# Altium project rp2350_led_control.PrjPcb (part 2 of 2)
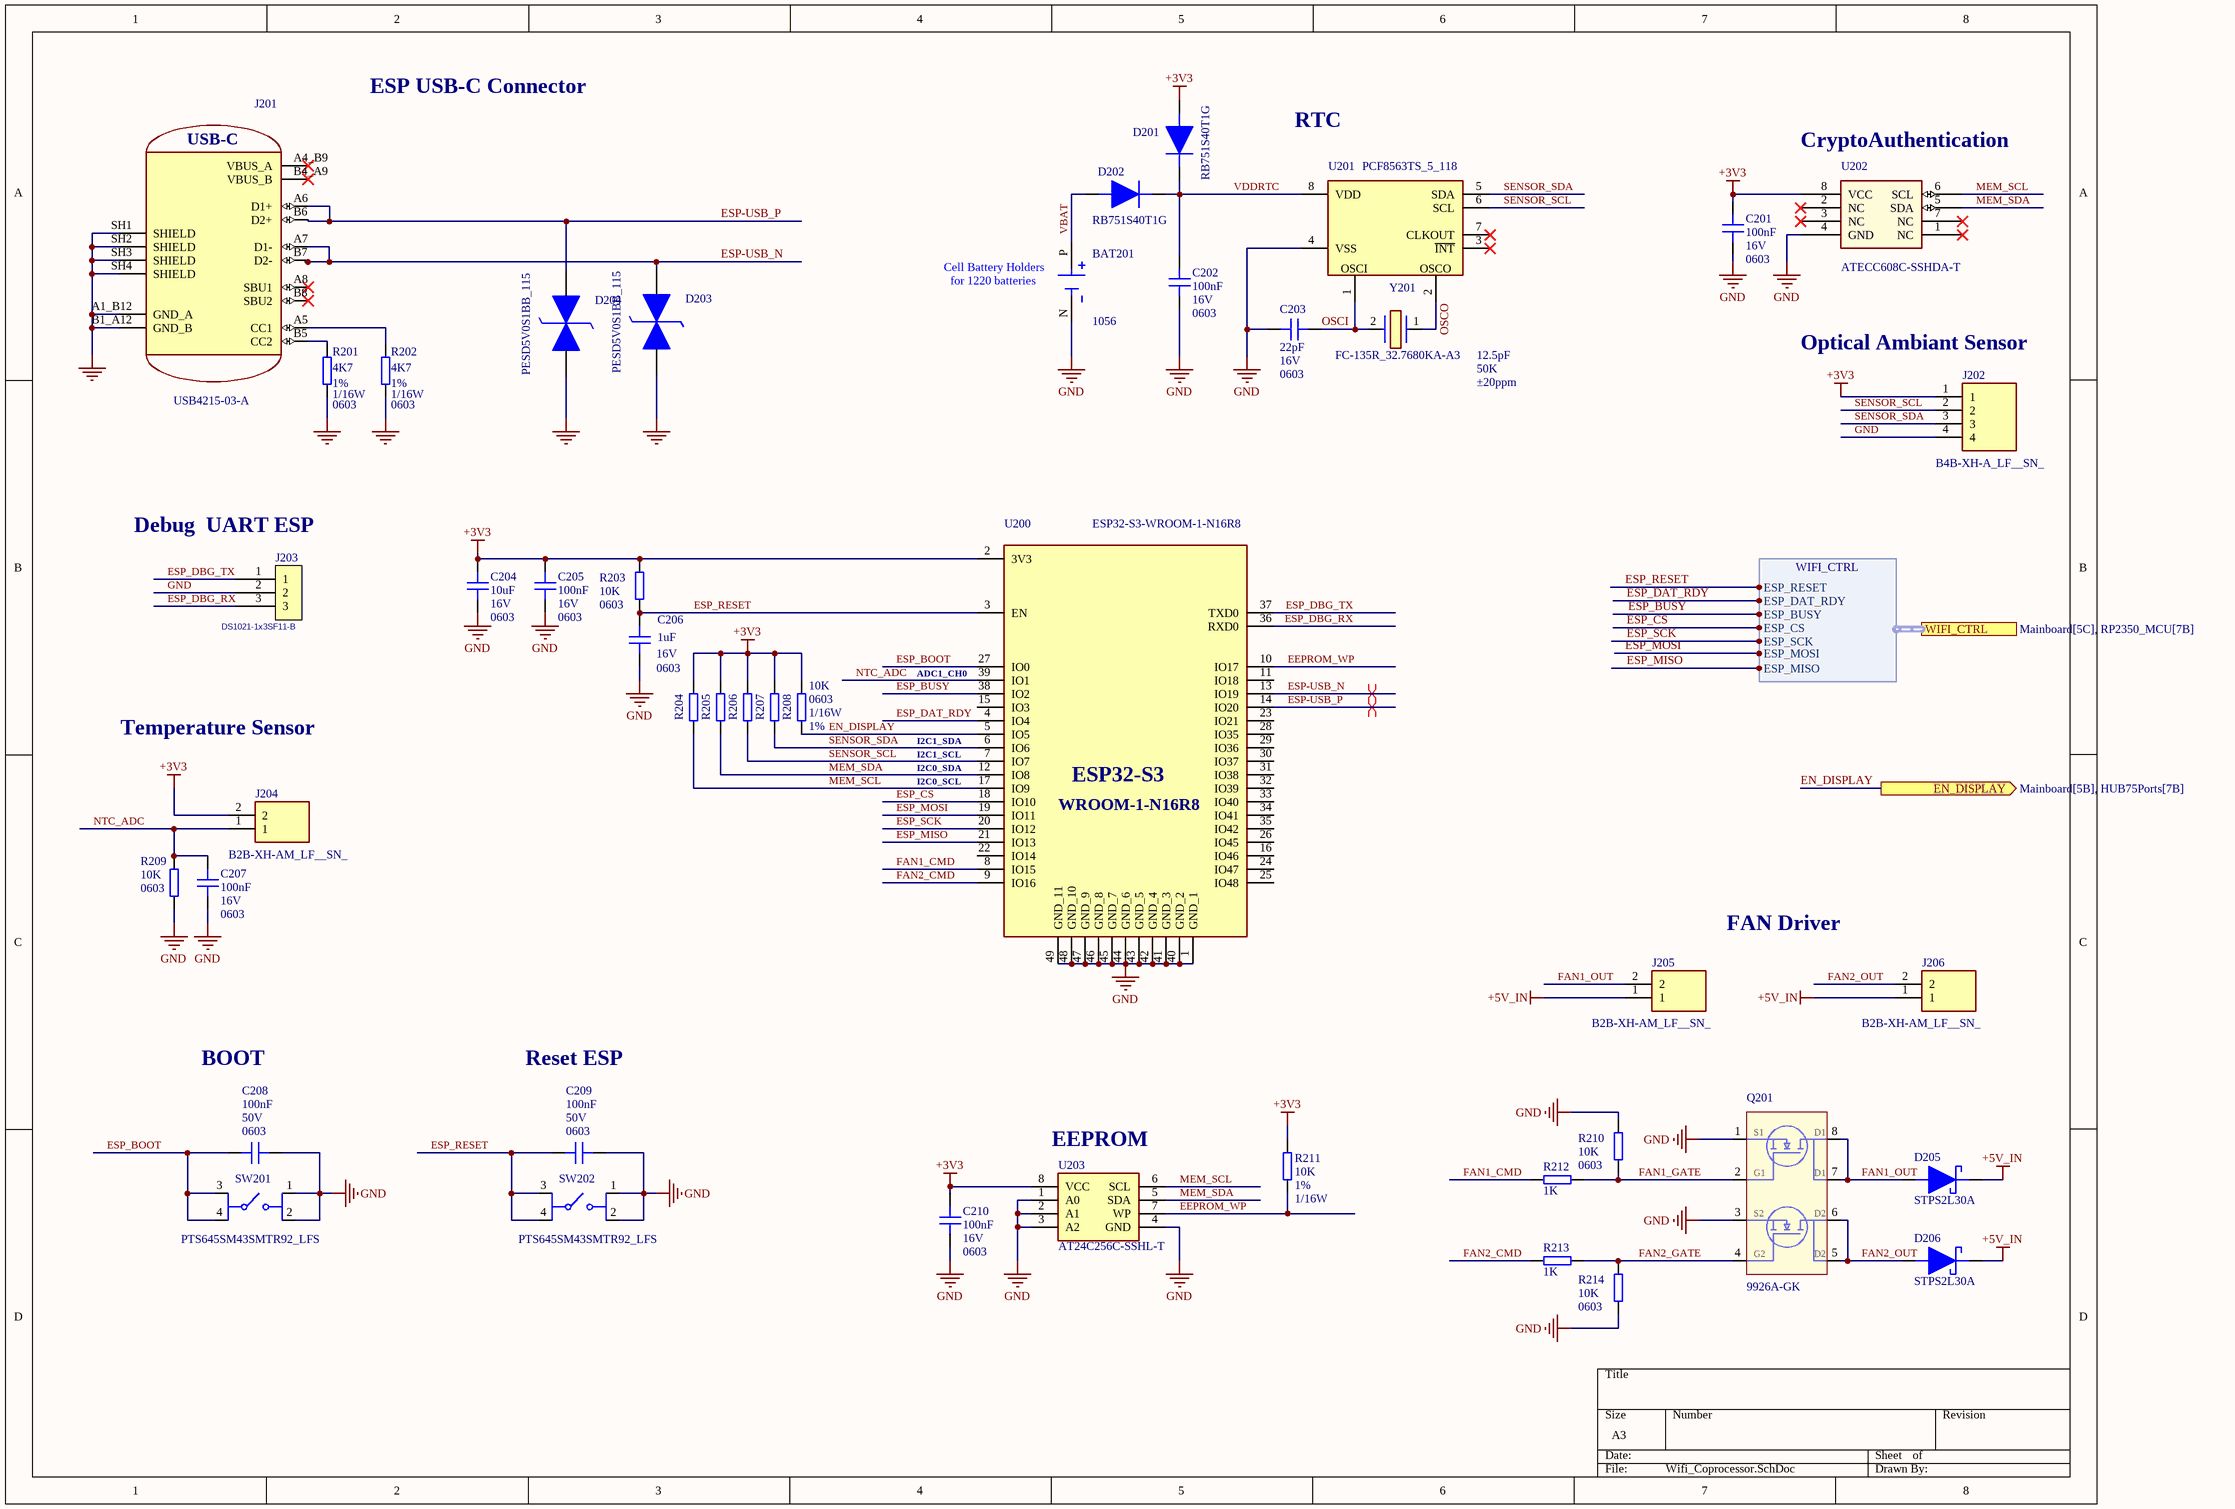
[diagram p5: Wifi_Coprocessor.SchDoc]

## Nets that join several sheets
+3V3: PowerSupply (5 pins), RP2350_MCU (38 pins), Wifi_Coprocessor (17 pins)
+5V: PowerSupply (8 pins), HUB75Ports (20 pins)
+5V_IN: PowerSupply (9 pins), RP2350_MCU (R103.2), Wifi_Coprocessor (D205.1 D206.1 J205.1 J206.1)
GND: PowerSupply (22 pins), RP2350_MCU (55 pins), HUB75Ports (56 pins), Wifi_Coprocessor (49 pins)
EN_DISPLAY: HUB75Ports (6 pins), Wifi_Coprocessor (R208.2 U200.5)
ESP_BUSY: RP2350_MCU (U100.53), Wifi_Coprocessor (U200.38)
ESP_CS: RP2350_MCU (U100.56), Wifi_Coprocessor (U200.18)
ESP_DAT_RDY: RP2350_MCU (U100.48), Wifi_Coprocessor (U200.4)
ESP_MISO: RP2350_MCU (U100.55), Wifi_Coprocessor (U200.21)
ESP_MOSI: RP2350_MCU (U100.54), Wifi_Coprocessor (U200.19)
ESP_RESET: RP2350_MCU (U100.47), Wifi_Coprocessor (6 pins)
ESP_SCK: RP2350_MCU (U100.57), Wifi_Coprocessor (U200.20)
HUB75_0_B1: RP2350_MCU (U100.79), HUB75Ports (U300.4)
HUB75_0_B2: RP2350_MCU (U100.2), HUB75Ports (U300.8)
HUB75_0_G1: RP2350_MCU (U100.78), HUB75Ports (U300.3)
HUB75_0_G2: RP2350_MCU (U100.1), HUB75Ports (U300.7)
HUB75_0_R1: RP2350_MCU (U100.77), HUB75Ports (U300.2)
HUB75_0_R2: RP2350_MCU (U100.80), HUB75Ports (U300.6)
HUB75_1_B1: RP2350_MCU (U100.6), HUB75Ports (U302.4)
HUB75_1_B2: RP2350_MCU (U100.9), HUB75Ports (U302.8)
HUB75_1_G1: RP2350_MCU (U100.4), HUB75Ports (U302.3)
HUB75_1_G2: RP2350_MCU (U100.8), HUB75Ports (U302.7)
HUB75_1_R1: RP2350_MCU (U100.3), HUB75Ports (U302.2)
HUB75_1_R2: RP2350_MCU (U100.7), HUB75Ports (U302.6)
HUB75_2_B1: RP2350_MCU (U100.13), HUB75Ports (U303.4)
HUB75_2_B2: RP2350_MCU (U100.17), HUB75Ports (U303.8)
HUB75_2_G1: RP2350_MCU (U100.12), HUB75Ports (U303.3)
HUB75_2_G2: RP2350_MCU (U100.16), HUB75Ports (U303.7)
HUB75_2_R1: RP2350_MCU (U100.11), HUB75Ports (U303.2)
HUB75_2_R2: RP2350_MCU (U100.14), HUB75Ports (U303.6)
HUB75_3_B1: RP2350_MCU (U100.20), HUB75Ports (U305.4)
HUB75_3_B2: RP2350_MCU (U100.23), HUB75Ports (U305.8)
HUB75_3_G1: RP2350_MCU (U100.19), HUB75Ports (U305.3)
HUB75_3_G2: RP2350_MCU (U100.22), HUB75Ports (U305.7)
HUB75_3_R1: RP2350_MCU (U100.18), HUB75Ports (U305.2)
HUB75_3_R2: RP2350_MCU (U100.21), HUB75Ports (U305.6)
HUB75_A: RP2350_MCU (U100.25), HUB75Ports (U301.2 U304.2)
HUB75_B: RP2350_MCU (U100.26), HUB75Ports (U301.3 U304.3)
HUB75_C: RP2350_MCU (U100.27), HUB75Ports (U301.4 U304.4)
HUB75_CLK: RP2350_MCU (U100.37), HUB75Ports (U301.7 U304.7)
HUB75_D: RP2350_MCU (U100.28), HUB75Ports (U301.5 U304.5)
HUB75_E: RP2350_MCU (U100.36), HUB75Ports (U301.6 U304.6)
HUB75_LAT: RP2350_MCU (U100.39), HUB75Ports (U301.8 U304.8)
HUB75_OE: RP2350_MCU (U100.38), HUB75Ports (U301.9 U304.9)